# EasyEDA Pro project ESP32S3_DMX_RDM_2026-06-09.epro, board PCB5
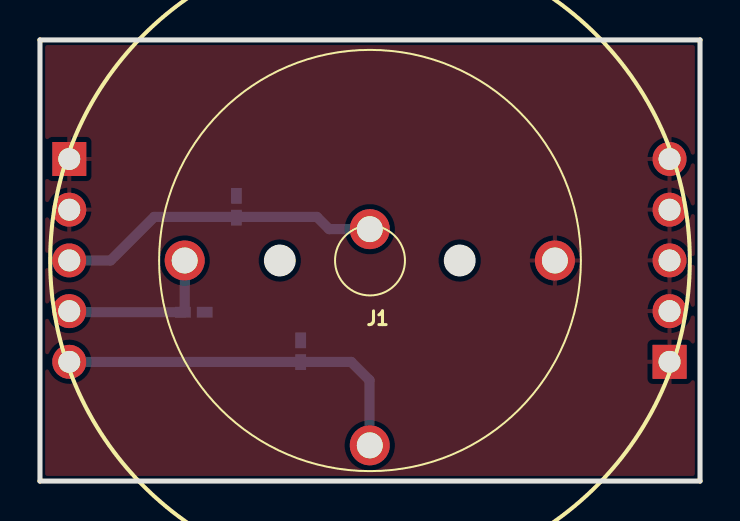
[diagram p9: board, top side]
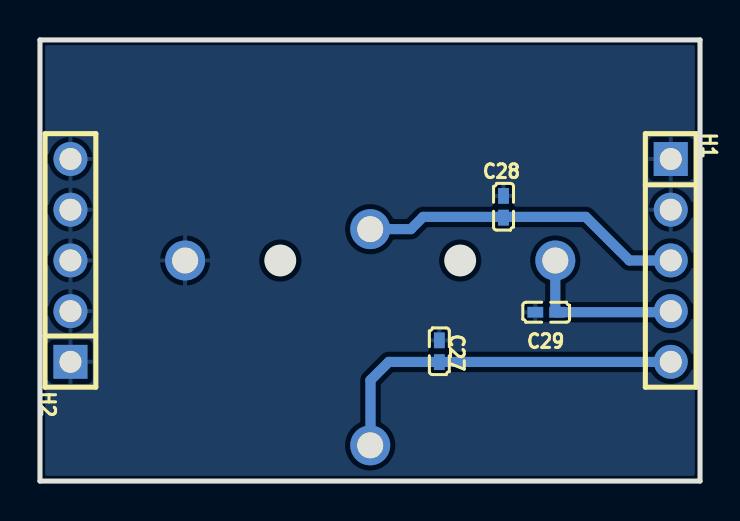
[diagram p10: board, bottom side, seen from below]

Outline 33.02 x 22.1 mm; copper layers: Top Layer, Bottom Layer. Coordinates in mm from the lower left corner of the outline.
Outline path: 0,22.1 33.02,22.1 33.02,0 0,0 0,22.1
Stack: Top Layer 0.035mm / Dielectric1 1.51mm FR4 er 4.5 / Bottom Layer 0.035mm

## Design rules (mm)
spacing copperThickness1oz (default): track to track 0.102, other pairs 0.152 to 0.3
spacing copperThickness2oz: track to track 0.203, other pairs 0.152 to 0.3
track width copperThickness1oz (default): min 0.127, default 0.254, max 2.54
track width copperThickness2oz: min 0.203, default 0.254, max 2.54
differential pair differentialPair (default): width min 0.127, default 0.254, max 2.54; gap min 0.152, default 0.152

## Placement (name value [footprint] x y rotation side)
C27  10nF  [C0402]  13.04 6.5 90 bottom
C28  10nF  [C0402]  9.83 13.74 90 bottom
C29  10nF  [C0402]  7.7 8.46 0 bottom
H1  PZ254V-11-05P  [HDR-TH_5P-P2.54-V-M]  1.47 11.05 270 bottom
H2  PZ254V-11-05P  [HDR-TH_5P-P2.54-V-M]  31.5 11.05 90 bottom
J1  -  [AN-P1S-2SP-Z]  7.24 11.05 0 top

## Footprints (pads in the part's own frame, mm; a bottom-side part is the same pattern mirrored in y, then rotated)
AN-P1S-2SP-Z
  round 2 hole 1.3: A(0,0) B(9.26,-9.26) COM(18.52,0) N0(9.26,1.57)
C0402
  rect 0.79x0.54 smd: 1(-0.545,0) 2(0.545,0)
HDR-TH_5P-P2.54-V-M
  rect 1.7x1.7 hole 1.1: 1(-5.08,0)
  round 1.7 hole 1.1: 2(-2.54,0) 3(0,0) 4(2.54,0) 5(5.08,0)

## Nets
As in the schematic.

## Routing (per net, layer and track width the routed paths; a pad name or vN(x,y) marks a point on that pad's centre or on a via; arc(x,y) is an arc through that point)
ENCODER_A: length 8.4
  Bottom Layer w0.508: J1.A 7.24,8.46 1.55,8.46 1.5,8.51
ENCODER_B: length 18.6
  Bottom Layer w0.508: 1.5,5.97 15.57,5.97 16.48,5.05 16.48,1.8 J1.B
ENCODER_KEY: length 16.2
  Bottom Layer w0.508: 1.5,11.05 3.53,11.05 5.72,13.23 13.85,13.23 14.47,12.62 J1.N0

## Copper pours and planes (outline as drawn; the poured copper is in the pictures)
GND on Top Layer: 0,22.1 33.02,22.1 33.02,0 0,0
GND on Bottom Layer: 0,22.1 33.02,22.1 33.02,0 0,0
